# Altium schematic sheet 0_Main.SchDoc
size A4; DocumentNumber: 1; SheetNumber: 1; SheetTotal: 1
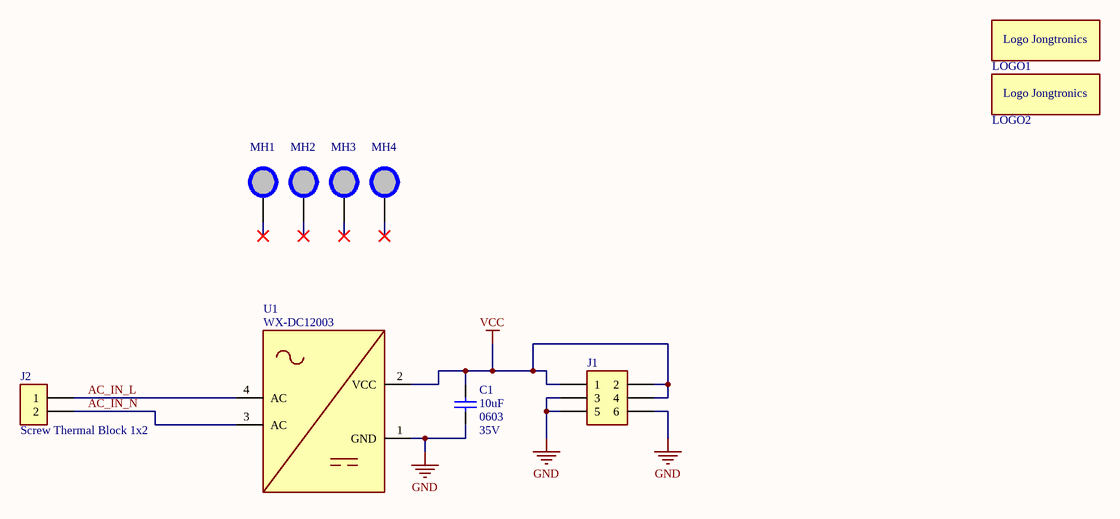
[diagram p0: 0_Main.SchDoc]

## Parts
C1  value 10uF  Footprint: 0603  Rated Voltage: 35V  [C0603]  (hidden comment: CAP-0603 10uF 35VDC 20% X5R)
J1  Header Male 2x3 - 3mm height - 0.05" (1.27mm)  [HEADER MALE 2x3 1.27MM]  (value not drawn)
J2  Part Number: Screw Thermal Block 1x2  [TH Block HB9500 1x2]  (hidden comment: Thermal Block 9.5mm pitch 750V Screw terminal 1x2)
LOGO1  Logo Jongtronics  [LOGO_JONGTRONICS]  (value not drawn)  (no BOM)
LOGO2  Logo Jongtronics  [LOGO_JONGTRONICS]  (value not drawn)  (no BOM)
MH1  Spacer Threaded M3 x 4mm SMD  [SPACER THREADED M3 x 4mm]  (value not drawn)
MH2  Spacer Threaded M3 x 4mm SMD  [SPACER THREADED M3 x 4mm]  (value not drawn)
MH3  Spacer Threaded M3 x 4mm SMD  [SPACER THREADED M3 x 4mm]  (value not drawn)
MH4  Spacer Threaded M3 x 4mm SMD  [SPACER THREADED M3 x 4mm]  (value not drawn)
U1  AC-DC 5V 700mA Precision Buck Converter Step Down Transformator Module  [WX-DC12003]  (value not drawn)

## Nets
GND: C1.1 J1.3 J1.5 J1.6 U1.1(GND)
VCC: C1.2 J1.1 J1.2 J1.4 U1.2(VCC)
AC_IN_L: J2.1 U1.4(AC)
AC_IN_N: J2.2 U1.3(AC)

Not connected (* = marked no-connect by the designer): MH1 MH*; MH2 MH*; MH3 MH*; MH4 MH*

## Notes on the sheet
- Project Name:
- Engineer:
- Revision:
- Jongtronics
- Rietlaan 5
- 3891GK
- Size:
- Sheet:
- Schematic:
- A4
- of
- The Netherlands
- Zeewolde

## Library data of the parts
C1 = C 0603 10uF 35V: Manufacturer 1: Murata Electronics; Manufacturer Part Number 1: GRM188R6YA106MA73D; Default Designator: C?; Case-Metric: 1608; Part Number: C 0603 10uF 35V; Supplier 1: Mouser; Supplier Part Number 1: 81-GRM188R6YA106MA3D; Case-EIA: 0603; Tolerance: 20%; Datasheet: https://nl.mouser.com/datasheet/2/281/murata_03052018_GRM_Series_1-1310166.pdf
J1 = Header Male 2x3 0.05" (1.27mm): Header Male 2x3 - 4.68mm height - 0.05" (1.27mm); Manufacturer 1: Harwin; Manufacturer Part Number 1: M50-3600342; Default Designator: J?; Part Number: Header Male 2x3 0.05" (1.27mm); Supplier 1: Mouser; Supplier Part Number 1: 855-M50-3600342; Datasheet: https://nl.mouser.com/ProductDetail/Harwin/M50-3600342?qs=uLfVlVfCHH3O1msIjvLxbQ%3D%3D
J2 = Screw Thermal Block 1x2: Manufacturer 1: Cixi Kefa Elec; Manufacturer Part Number 1: HB9500-9.5-2P; Default Designator: J?; Supplier 1: LCSC Electronics; Supplier Part Number 1: C707836; Datasheet: https://datasheet.lcsc.com/lcsc/2010111035_Cixi-Kefa-Elec-HB9500-9-5-2P_C707836.pdf
LOGO1 LOGO2 = Logo Jongtronics: Default Designator: LOGO?; Part Number: Logo Jongtronics
MH1-MH4 = Spacer Threaded M3 x 4mm: Manufacturer 1: Wurth Elektronik; Manufacturer Part Number 1: 78614040360; Default Designator: MH?; Part Number: Spacer Threaded M3 x 4mm; Supplier 1: Mouser; Supplier Part Number 1: 710-78614040360; Datasheet: https://www.we-online.com/components/products/datasheet/78614040360.pdf
U1 = WX-DC12003: Default Designator: U?; Part Number: WX-DC12003; Manufacturer Part Number 1: WX-DC12003